# Altium project Custom_Keyboard.PrjPcb (part 2 of 4)

## Sheet Power_Section.SchDoc
size A4; SheetNumber: 2
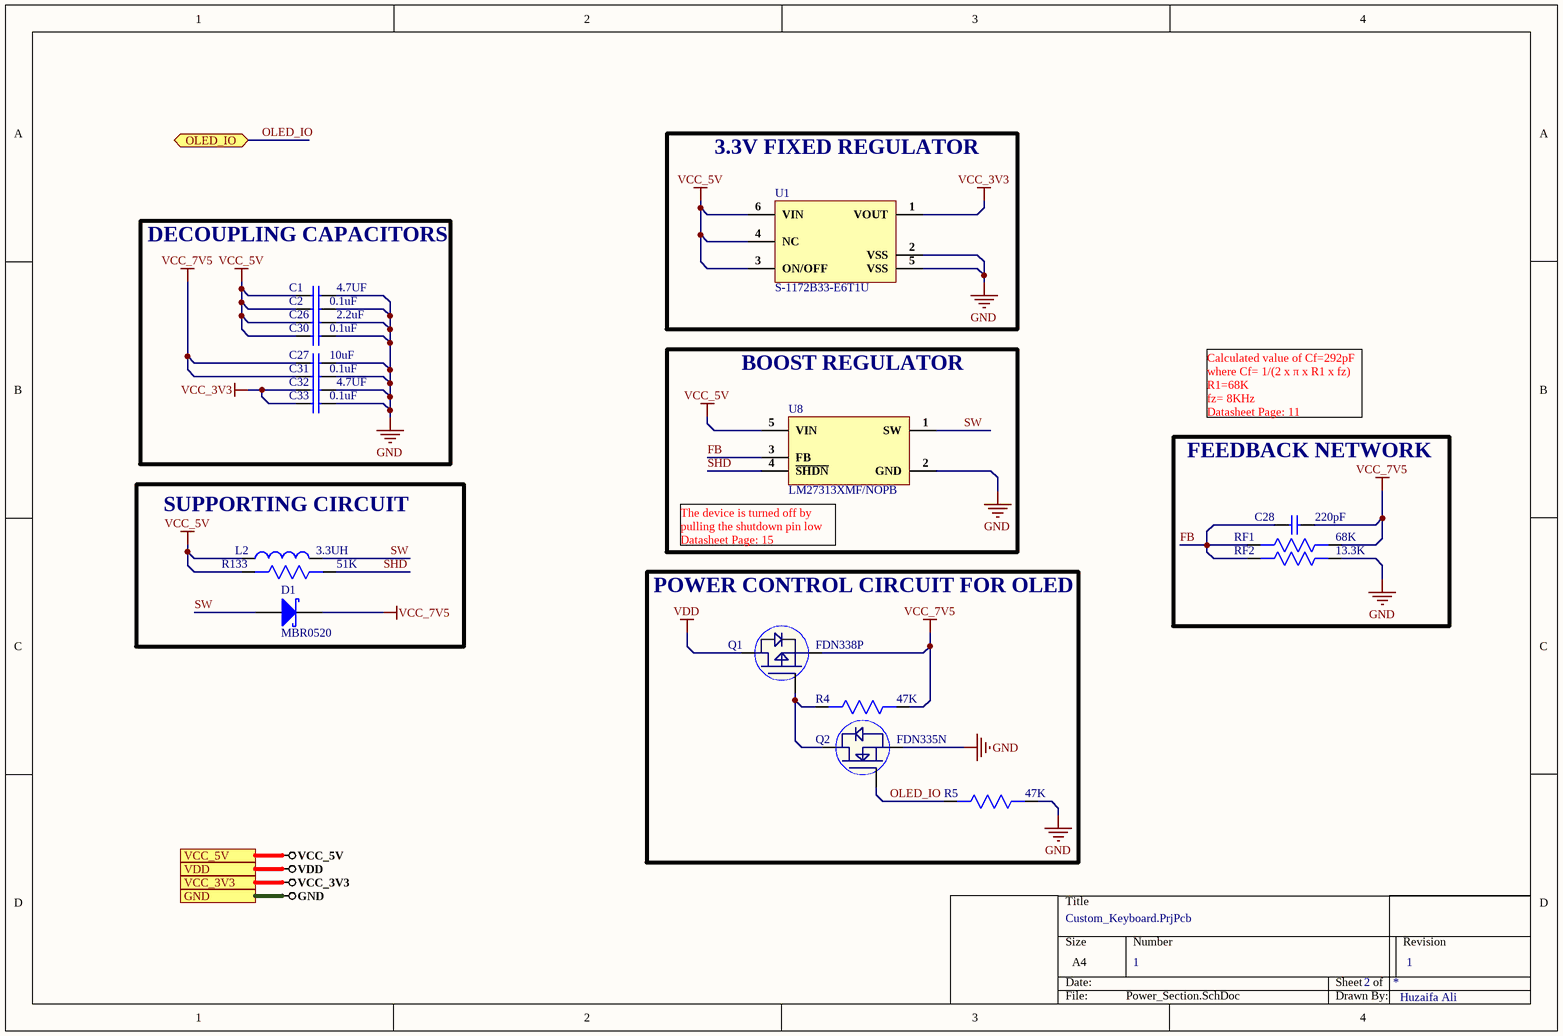
[diagram p4: Power_Section.SchDoc]

### Parts
C1  4.7UF  [Cap0603]
C2  0.1uF  [Cap0603]
C26  2.2uF  [Cap 0402]
C27  10uF  [Cap0603]
C28  220pF  [Cap0603]
C30  0.1uF  [Cap0603]
C31  0.1uF  [Cap0603]
C32  4.7UF  [Cap0603]
C33  0.1uF  [Cap0603]
D1  MBR0520  [SOD-123]
L2  3.3UH  [74437368033]
Q1  FDN338P  [SOT23-3]
Q2  FDN335N  [SOT23-3]
R4  47K  [Res0402]
R5  47K  [Res0402]
R133  51K  [Res0603]
RF1  68K  [Res0603]
RF2  13.3K  [Res0603]
U1  S-1172B33-E6T1U  [HSOP-6]
U8  LM27313XMF/NOPB  [SOT23-5]

### Blocks framed on the sheet
3.3V FIXED REGULATOR: U1
DECOUPLING CAPACITORS: C1 C2 C26 C27 C30-C33
BOOST REGULATOR: U8
FEEDBACK NETWORK: C28 RF1 RF2
SUPPORTING CIRCUIT: D1 L2 R133
POWER CONTROL CIRCUIT FOR OLED: Q1 Q2 R4 R5

### Ports
GND, OLED_IO (bidir), VCC_3V3, VCC_5V, VDD

### Nets
GND: C1.2 C2.2 C26.2 C27.2 C30.2 C31.2 C32.2 C33.2 Q2.2(S) R5.1 RF2.1 U1.2(VSS) U1.5(VSS) U8.2(GND) ; port GND
VCC_3V3: C32.1 C33.1 U1.1(VOUT) ; port VCC_3V3
VCC_5V: C1.1 C2.1 C26.1 C30.1 L2.1 R133.2 U1.3(ON/OFF) U1.4(NC) U1.6(VIN) U8.5(VIN) ; port VCC_5V
VCC_7V5: C27.1 C28.2 C31.1 D1.2(K) Q1.2(S) R4.1 RF1.1
VDD: Q1.3(D) ; port VDD
FB: C28.1 RF1.2 RF2.2 U8.3(FB)
OLED_IO: Q2.1(G) R5.2 ; port OLED_IO
SHD: R133.1 U8.4(~{SHDN})
SW: D1.1(A) L2.2 U8.1(SW)
NetQ1_1: Q1.1(G) Q2.3(D) R4.2

### Notes on the sheet
- Calculated value of Cf=292pF
  where Cf= 1/(2 x π x R1 x fz)
  R1=68K
  fz= 8KHz
  Datasheet Page: 11
- (near U8) The device is turned off by pulling the shutdown pin low
  Datasheet Page: 15
- 1
- Huzaifa Ali

### Library data of the parts
C1 C32 = CL10A475KA8NQNC: CAP CER 4.7UF 25V X5R 0603; Manufacturer: Samsung; Tolerance: 10%; Supplier 1: Digi-Key; Manufacturer Part Number: CL10A475KA8NQNC; Stock 1: 2252340; Pricing 1: 1=0.37, 10=0.255, 100=0.1528, 500=0.11456, 1000=0.09675 (USD); Mount: Surface Mount; Case/Package: 0603; Case Code (Metric): 1608; Case Code (Imperial): 0603; Contact Plating: Tin; Min Operating Temperature: -55°C; Max Operating Temperature: 85°C; Package Quantity: 1; Packaging: Tape and Reel; Capacitance: 4.7uF; Voltage Rating: 25V; Dielectric: X5R; Termination: Wraparound; Length: 1.6mm; Width: 0.031inch; Thickness: 0.035inch; Depth: 0.8mm; Lead Free: Lead Free; ComponentLink1URL: http://www.samsungsem.com/kr/support/product-search/mlcc/CL10A475KA8NQNC.jsp?src-supplier=Digi-Key; ComponentLink1Description: http://www.samsungsem.com/kr/support/product-search/mlcc/CL10A475KA8NQNC.jsp?src-supplier=Digi-Key; Supplier Part Number 1: 1276-1900-1-ND
C2 C30 C31 C33 = CC0603ZRY5V9BB104: CAP CER 0.1UF 50V Y5V 0603; Manufacturer: Yageo; Capacitance: 100nF; Tolerance: 80%; Supplier 1: Digi-Key; Manufacturer Part Number: CC0603ZRY5V9BB104; Stock 1: 15000880; Pricing 1: 1=0.1, 10=0.075, 100=0.0334, 500=0.02386, 1000=0.01874 (USD); Mount: Surface Mount; Case/Package: 0603; Number of Pins: 2; Case Code (Metric): 1608; Case Code (Imperial): 0603; Min Operating Temperature: -30°C; Max Operating Temperature: 85°C; Dielectric: Y5V; Voltage Rating: 50V; Package Quantity: 1; Packaging: Tape and Reel; Voltage Rating (DC): 50V; Termination: SMD/SMT; Composition: Ceramic; Voltage: 50V; Length: 1.6mm; Height: 0.8mm; Width: 0.031inch; Thickness: 0.035inch; Depth: 0.8mm; Radiation Hardening: No; REACH SVHC: No SVHC; Lead Free: Lead Free; Halogen Free: Halogen Free; ComponentLink1URL: http://www.yageo.com/documents/recent/UPY-GPHC_Y5V_6.3V-to-50V_8.pdf?src-supplier=Digi-Key; ComponentLink1Description: http://www.yageo.com/documents/recent/UPY-GPHC_Y5V_6.3V-to-50V_8.pdf?src-supplier=Digi-Key; ComponentLink2URL: http://www.yageo.com/documents/recent/UPY-GPHC_Y5V_6.3V-to-50V_5.pdf?src-supplier=Avnet+Europe; ComponentLink2Description: http://www.yageo.com/documents/recent/UPY-GPHC_Y5V_6.3V-to-50V_5.pdf?src-supplier=Avnet+Europe; ComponentLink3URL: https://www.verical.com/server-webapp/html/getDatasheet?partID=403611&src-supplier=Verical; ComponentLink3Description: https://www.verical.com/server-webapp/html/getDatasheet?partID=403611&src-supplier=Verical; ComponentLink4URL: http://www.mouser.com/ds/2/447/Yageo_UPY-GP_NP0_16V-to-50V_9-358835.pdf?src-supplier=Mouser; ComponentLink4Description: http://www.mouser.com/ds/2/447/Yageo_UPY-GP_NP0_16V-to-50V_9-358835.pdf?src-supplier=Mouser; ComponentLink5URL: http://www.farnell.com/datasheets/1132289.pdf?src-supplier=Element14; ComponentLink5Description: http://www.farnell.com/datasheets/1132289.pdf?src-supplier=Element14; Supplier Part Number 1: 311-1343-1-ND
C26 = EMK105ABJ225KV-F: CAP CER 2.2UF 16V X5R 0402; Manufacturer: Taiyo Yuden; Tolerance: 10%; Supplier 1: Digi-Key; Manufacturer Part Number: EMK105ABJ225KV-F; Stock 1: 755; Pricing 1: 1=0.2, 10=0.139, 100=0.0706, 500=0.04834, 1000=0.04276, 2500=0.0409, 5000=0.03718 (USD); Mount: Surface Mount; Case/Package: 0402; Case Code (Imperial): 0402; Case Code (Metric): 1005; Min Operating Temperature: -55°C; Max Operating Temperature: 85°C; Packaging: Tape and Reel; Capacitance: 2.2uF; Voltage Rating: 16V; Lead Free: Lead Free; ComponentLink1URL: http://ds.yuden.co.jp/TYCOMPAS/ut/detail.do?productNo=EMK105ABJ225KV-F&amp;fileName=EMK105ABJ225KV-F_SS&amp;mode=specSheetDownload&src-supplier=Digi-Key; ComponentLink1Description: http://ds.yuden.co.jp/TYCOMPAS/ut/detail.do?productNo=EMK105ABJ225KV-F&amp;fileName=EMK105ABJ225KV-F_SS&amp;mode=specSheetDownload&src-supplier=Digi-Key; ComponentLink2URL: https://ds.yuden.co.jp/TYCOMPAS/ut/detail?pn=EMK105ABJ225KV-F &amp;u=M&src-supplier=Digi-Key; ComponentLink2Description: https://ds.yuden.co.jp/TYCOMPAS/ut/detail?pn=EMK105ABJ225KV-F &amp;u=M&src-supplier=Digi-Key; Supplier Part Number 1: 587-6002-1-ND
C27 = C1608X5R1E106M080AC: CAP CER 10UF 25V X5R 0603; Manufacturer: TDK; Dielectric Material: Ceramic; Tolerance: 20%; Supplier 1: Digi-Key; Manufacturer Part Number: C1608X5R1E106M080AC; Stock 1: 61681; Pricing 1: 1=0.96, 10=0.704, 100=0.483, 500=0.38238, 1000=0.322 (USD); Mount: Surface Mount; Case/Package: 0603; Weight: 7.1E-05oz; Case Code (Imperial): 0603; Case Code (Metric): 1608; Min Operating Temperature: -55°C; Max Operating Temperature: 85°C; Capacitance: 10uF; Packaging: Tape and Reel; Voltage Rating: 25V; Voltage Rating (DC): 25V; Termination: SMD/SMT; Package Quantity: 1; Dielectric: X5R; Composition: Ceramic; Length: 1.6mm; Height: 0.8mm; Width: 0.8mm; Thickness: 0.039inch; Depth: 0.8mm; Lead Free: Lead Free; REACH SVHC: No SVHC; Supplier Part Number 1: 445-9015-1-ND
C28 = CC0603KRX7R9BB221: CAP CER 220PF 50V X7R 0603; Manufacturer: Yageo; Dielectric Material: Ceramic; Tolerance: 10%; Insulation Resistance: 100GR; Supplier 1: RSComponents; Manufacturer Part Number: CC0603KRX7R9BB221; RoHS: Yes; Category: Ceramic Capacitors; Stock 1: 3500; Pricing 1: 4000=0.00700, 12000=0.00700 (GBP); Mount: Surface Mount; Case/Package: 0603; Number of Pins: 2; Case Code (Metric): 1608; Case Code (Imperial): 0603; Min Operating Temperature: -55°C; Max Operating Temperature: 125°C; Capacitance: 220pF; Dielectric: X7R; Series: CC; Voltage Rating: 50V; Voltage Rating (DC): 50V; Packaging: Tape and Reel; Package Quantity: 1; Termination: SMD/SMT; Resistor Type: Ceramic; Length: 1.6mm; Width: 0.031inch; Height: 0.8mm; Depth: 0.8mm; Thickness: 0.035inch; Radiation Hardening: No; RoHS Compliant: Yes; REACH SVHC: No SVHC; Lead Free: Lead Free; Halogen Free: Halogen Free; ComponentLink1URL: https://datasheet.ciiva.com/7978/1489800-7978170.pdf?src-supplier=Element14; ComponentLink1Description: https://datasheet.ciiva.com/7978/1489800-7978170.pdf?src-supplier=Element14; ComponentLink2URL: https://datasheet.ciiva.com/144/mlccorderingcode-144452.pdf?src-supplier=Digi-Key; ComponentLink2Description: https://datasheet.ciiva.com/144/mlccorderingcode-144452.pdf?src-supplier=Digi-Key; ComponentLink3URL: https://datasheet.ciiva.com/144/mlccorderingcode-144451.pdf?src-supplier=Digi-Key; ComponentLink3Description: https://datasheet.ciiva.com/144/mlccorderingcode-144451.pdf?src-supplier=Digi-Key; ComponentLink4URL: https://datasheet.ciiva.com/144/mlccorderingcode-144453.pdf?src-supplier=Digi-Key; ComponentLink4Description: https://datasheet.ciiva.com/144/mlccorderingcode-144453.pdf?src-supplier=Digi-Key; ComponentLink5URL: https://datasheet.ciiva.com/5425/upy-gphc-x7r-6-3v-to-50v-8-5425432.pdf?src-supplier=Mouser; ComponentLink5Description: https://datasheet.ciiva.com/5425/upy-gphc-x7r-6-3v-to-50v-8-5425432.pdf?src-supplier=Mouser; ComponentLink6URL: https://datasheet.ciiva.com/8033/1489800-8033855.pdf?src-supplier=Element14; ComponentLink6Description: https://datasheet.ciiva.com/8033/1489800-8033855.pdf?src-supplier=Element14; ComponentLink7URL: https://datasheet.ciiva.com/11587/upy-gphc-x7r-6-3v-to-50v-8-11587223.pdf?src-supplier=Avnet; ComponentLink7Description: https://datasheet.ciiva.com/11587/upy-gphc-x7r-6-3v-to-50v-8-11587223.pdf?src-supplier=Avnet; Supplier Part Number 1: 2006602
D1 = MBR0520: 20V 450mV@500mA 500mA SOD-123 Schottky Barrier Diodes (SBD) ROHS; Manufacturer: Yangzhou; Manufacturer Part Number: MBR0520; ComponentLink1Description: LCSC; ComponentLink1URL: https://www.lcsc.com/product-detail/Schottky-Barrier-Diodes-SBD_Yangzhou-Yangjie-Elec-Tech-MBR0520_C699111.html
L2 = 74437368033: FIXED IND 3.3UH 8A 11.8 MOHM SMD; Manufacturer: Wurth Electronics; Core Material: Ferrite,Composite; Tolerance: 20%; Saturation Current: 23A; Shielding: Shielded; Self Resonant Frequency: 22MHz; DC Resistance (DCR): 11.8mR; Test Frequency: 100kHz; ComponentLink1URL: http://www.farnell.com/datasheets/1735871.pdf?src-supplier=Element14; ComponentLink1Description: http://www.farnell.com/datasheets/1735871.pdf?src-supplier=Element14; ComponentLink2URL: http://www.mouser.com/ds/2/445/74437368022-538992.pdf?src-supplier=Mouser; ComponentLink2Description: http://www.mouser.com/ds/2/445/74437368022-538992.pdf?src-supplier=Mouser; ComponentLink3URL: http://katalog.we-online.de/pbs/datasheet/74437368022.pdf?src-supplier=Digi-Key; ComponentLink3Description: http://katalog.we-online.de/pbs/datasheet/74437368022.pdf?src-supplier=Digi-Key; ComponentLink4URL: http://documents.rs-components.com/techlib://itc_doclist_GB.htm?stockno=7568629&src-supplier=RSComponents; ComponentLink4Description: http://documents.rs-components.com/techlib://itc_doclist_GB.htm?stockno=7568629&src-supplier=RSComponents; ComponentLink5URL: http://www.produktinfo.conrad.com/datenblaetter/1000000-1099999/001087607-da-01-ml-WE_LHMI_SMD_SPEICHERDROSSEL_744373_de_en.pdf?src-supplier=Conrad; ComponentLink5Description: http://www.produktinfo.conrad.com/datenblaetter/1000000-1099999/001087607-da-01-ml-WE_LHMI_SMD_SPEICHERDROSSEL_744373_de_en.pdf?src-supplier=Conrad; Supplier 1: Digi-Key; Manufacturer Part Number: 74437368033; RoHS: Yes; Category: Fixed Inductors; Stock 1: 1240; Pricing 1: 1=2.41000, 10=2.35900, 50=2.17700, 100=1.99600, 250=1.90500 (USD); Mount: Surface Mount; Case/Package: Nonstandard; Min Operating Temperature: -40°C; Max Operating Temperature: 125°C; Inductance Tolerance: 20%; Package Quantity: 500; Current Rating: 8A; Packaging: Tape and Reel; Resistor Type: Wirewound; Inductance: 3.3uH; Max DC Current: 8A; Termination: SMD/SMT; RMS Current (Irms): 8A; Series: WE-LHMI; Frequency: 22MHz; Series Resistance: 11.8MR; Length: 11mm; Width: 10mm; Height: 3.8mm; Height - Seated (Max): 0.157inch; Depth: 10mm; REACH SVHC: Unknown; RoHS Compliant: Yes; ComponentLink6URL: https://datasheet.ciiva.com/7354/74437368033-7354466.pdf?src-supplier=Newark; ComponentLink6Description: https://datasheet.ciiva.com/7354/74437368033-7354466.pdf?src-supplier=Newark; ComponentLink7URL: https://datasheet.ciiva.com/7691/1735872-7691596.pdf?src-supplier=Element14; ComponentLink7Description: https://datasheet.ciiva.com/7691/1735872-7691596.pdf?src-supplier=Element14; ComponentLink8URL: https://datasheet.ciiva.com/4961/74437368033-89775-4961151.pdf?src-supplier=Mouser; ComponentLink8Description: https://datasheet.ciiva.com/4961/74437368033-89775-4961151.pdf?src-supplier=Mouser; ComponentLink9URL: https://datasheet.ciiva.com/6693/74437368033-6693468.pdf?src-supplier=Digi-Key; ComponentLink9Description: https://datasheet.ciiva.com/6693/74437368033-6693468.pdf?src-supplier=Digi-Key; ComponentLink10URL: https://datasheet.ciiva.com/6693/74437368033-6693470.pdf?src-supplier=Digi-Key; ComponentLink10Description: https://datasheet.ciiva.com/6693/74437368033-6693470.pdf?src-supplier=Digi-Key; ComponentLink11URL: https://datasheet.ciiva.com/6693/74437368033-6693471.pdf?src-supplier=Digi-Key; ComponentLink11Description: https://datasheet.ciiva.com/6693/74437368033-6693471.pdf?src-supplier=Digi-Key; ComponentLink12URL: https://datasheet.ciiva.com/48690/001087608-da-01-ml-we-lhmi-smd-speicherdrossel-744373-de-en-48690487.pdf?src-supplier=Conrad; ComponentLink12Description: https://datasheet.ciiva.com/48690/001087608-da-01-ml-we-lhmi-smd-speicherdrossel-744373-de-en-48690487.pdf?src-supplier=Conrad; Supplier Part Number 1: 732-3388-1-ND
Q1 = FDN338P: 20V 1.6A 500mW 115mΩ@4.5V,1.6A 1.5V@250μA P Channel SOT-23 MOSFETs ROHS; Manufacturer: UMW; Manufacturer Part No: FDN338P; Package: SOT-23
Q2 = FDN335N: SOT-23 MOSFETs ROHS; Manufacturer: UMW; Manufacturer Part No: FDN335N; Package: SOT-23; Value: *; ComponentLink1Description: LCSC; ComponentLink1URL: https://lcsc.com/product-detail/MOSFETs_UMW-Youtai-Semiconductor-Co-Ltd-FDN335N_C347512.html
R4 R5 = RC0402FR-0747KL: RES SMD 47K OHM 1% 1/16W 0402; Manufacturer: Yageo; Power Rating: 62.5mW; Temperature Coefficient: 100ppm/°C; Voltage Rating: 50V; Resistance: 47kR; Max Power Dissipation: 63mW; Supplier 1: Digi-Key; Manufacturer Part Number: RC0402FR-0747KL; Stock 1: 0; Pricing 1: 1=0.1, 10=0.016, 100=0.0064, 1000=0.00289, 2500=0.00251, 5000=0.00207 (USD); Case/Package: 0402; Case Code (Imperial): 0402; Case Code (Metric): 1005; Min Operating Temperature: -55°C; Max Operating Temperature: 155°C; Tolerance: 1%; Packaging: Tape and Reel; Package Quantity: 1; Termination: SMD/SMT; Composition: Thick Film; Number of Terminations: 2; Military Standard: Not; Features: Moisture Resistant; Length: 1mm; Height: 0.016inch; Depth: 0.5mm; Width: 0.5mm; REACH SVHC: Unknown; Lead Free: Lead Free; ComponentLink1URL: http://www.yageo.com/documents/recent/PYu-RC0402_51_RoHS_L_6_r.pdf?src-supplier=Future+Electronics; ComponentLink1Description: http://www.yageo.com/documents/recent/PYu-RC0402_51_RoHS_L_6_r.pdf?src-supplier=Future+Electronics; ComponentLink2URL: http://www.farnell.com/datasheets/1018594.pdf?src-supplier=Element14; ComponentLink2Description: http://www.farnell.com/datasheets/1018594.pdf?src-supplier=Element14; ComponentLink3URL: https://www.verical.com/server-webapp/html/getDatasheet?partID=323748&src-supplier=Verical; ComponentLink3Description: https://www.verical.com/server-webapp/html/getDatasheet?partID=323748&src-supplier=Verical; ComponentLink4URL: http://www.yageo.com/documents/recent/PYu-RC_Group_51_RoHS_L_10.pdf?src-supplier=Digi-Key; ComponentLink4Description: http://www.yageo.com/documents/recent/PYu-RC_Group_51_RoHS_L_10.pdf?src-supplier=Digi-Key; Supplier Part Number 1: 311-47.0KLRDKR-ND
R133 = RMCF0603FT51K0: Res Thick Film 0603 51K Ohm 1% 0.1W(1/10W) ±100ppm/C Pad SMD Automotive T/R; Manufacturer: Stackpole Electronics; Resistance: 51kR; Max Power Dissipation: 100mW; Temperature Coefficient: 100ppm/°C; Supplier 1: Digi-Key; Manufacturer Part Number: RMCF0603FT51K0; RoHS: Yes; Category: Chip SMD Resistors; Stock 1: 628549; Pricing 1: 1=0.10000, 10=0.01700, 100=0.00680, 1000=0.00305, 2500=0.00264 (USD); Mount: Surface Mount; Case/Package: 0603; Case Code (Metric): 1608; Case Code (Imperial): 0603; Contact Plating: Tin,Matte; Min Operating Temperature: -55°C; Max Operating Temperature: 155°C; Tolerance: 1%; Packaging: Tape and Reel; Resistor Type: Thick Film; Number of Terminations: 2; Features: Automotive AEC-Q200; Series: RMCF; Length: 0.061inch; Width: 0.031inch; Height: 0.022inch; Radiation Hardening: No; RoHS Compliant: Yes; ComponentLink1URL: http://components.arrow.com/part/dataview/40961090S7167716N1174?src-supplier=Arrow+Electronics; ComponentLink1Description: http://components.arrow.com/part/dataview/40961090S7167716N1174?src-supplier=Arrow+Electronics; ComponentLink2URL: https://www.seielect.com/catalog/SEI-RMCF_RMCP.pdf?src-supplier=Avnet; ComponentLink2Description: https://www.seielect.com/catalog/SEI-RMCF_RMCP.pdf?src-supplier=Avnet; ComponentLink3URL: https://www.seielect.com/catalog/SEI-Packaging.pdf?src-supplier=Digi-Key; ComponentLink3Description: https://www.seielect.com/catalog/SEI-Packaging.pdf?src-supplier=Digi-Key; Supplier Part Number 1: RMCF0603FT51K0CT-ND
RF1 = RC0603FR-0768KL: RES SMD 68K OHM 1% 1/10W 0603; Manufacturer: Yageo; Power Rating: 100mW; Resistance: 68kR; Voltage Rating: 50V; Temperature Coefficient: 100ppm/°C; Supplier 1: Digi-Key; Manufacturer Part Number: RC0603FR-0768KL; Stock 1: 3330967; Pricing 1: 1=0.1, 10=0.023, 100=0.0094, 1000=0.00421, 2500=0.00366 (USD); Case/Package: 0603; Number of Pins: 2; Case Code (Metric): 1608; Case Code (Imperial): 0603; Min Operating Temperature: -55°C; Max Operating Temperature: 155°C; Package Quantity: 1; Tolerance: 1%; Packaging: Tape and Reel; Voltage Rating (DC): 50V; Composition: Thick Film; Number of Terminations: 2; Termination: SMD/SMT; Max Power Dissipation: 100mW; Features: Moisture Resistant; Length: 0.063inch; Height: 0.022inch; Width: 0.031inch; Depth: 0.8mm; REACH SVHC: Unknown; Lead Free: Lead Free; ComponentLink1URL: http://www.yageo.com/documents/recent/PYu-RC_Group_51_RoHS_L_10.pdf?src-supplier=Digi-Key; ComponentLink1Description: http://www.yageo.com/documents/recent/PYu-RC_Group_51_RoHS_L_10.pdf?src-supplier=Digi-Key; ComponentLink2URL: http://documents.rs-components.com/techlib://itc_doclist_GB.htm?stockno=5048243&src-supplier=RSComponents; ComponentLink2Description: http://documents.rs-components.com/techlib://itc_doclist_GB.htm?stockno=5048243&src-supplier=RSComponents; ComponentLink3URL: http://www.yageo.com/documents/recent/PYu-RC_Group_51_RoHS_L_9.pdf?src-supplier=Digi-Key; ComponentLink3Description: http://www.yageo.com/documents/recent/PYu-RC_Group_51_RoHS_L_9.pdf?src-supplier=Digi-Key; ComponentLink4URL: http://www.farnell.com/datasheets/1868787.pdf?src-supplier=Element14; ComponentLink4Description: http://www.farnell.com/datasheets/1868787.pdf?src-supplier=Element14; ComponentLink5URL: http://www.farnell.com/datasheets/443971.pdf?src-supplier=Element14; ComponentLink5Description: http://www.farnell.com/datasheets/443971.pdf?src-supplier=Element14; ComponentLink6URL: http://www.farnell.com/datasheets/2167052.pdf?src-supplier=Element14; ComponentLink6Description: http://www.farnell.com/datasheets/2167052.pdf?src-supplier=Element14; Supplier Part Number 1: 311-68.0KHRCT-ND
RF2 = AC0603FR-0713K3L: RES SMD 13.3K OHM 1% 1/10W 0603; Manufacturer: Yageo; Resistance: 13.3kR; Max Power Dissipation: 100mW; Temperature Coefficient: 100ppm/°C; Supplier 1: Digi-Key; Manufacturer Part Number: AC0603FR-0713K3L; RoHS: Yes; Category: Chip SMD Resistors; Stock 1: 500; Pricing 1: 1=0.10000, 10=0.02900, 100=0.01170, 1000=0.00527, 2500=0.00458 (USD); Case/Package: 0603; Min Operating Temperature: -55°C; Max Operating Temperature: 155°C; Packaging: Tape and Reel; Resistor Type: Thick Film; Number of Terminations: 2; Tolerance: 1%; Features: Moisture Resistant,Automotive AEC-Q200; Length: 0.063inch; Width: 0.031inch; Height: 0.022inch; RoHS Compliant: Yes; ComponentLink1URL: http://www.yageo.com/NewPortal/yageodocoutput?fileName=/pdf/R-Chip/PYu-AC_51_RoHS_L_6.pdf&src-supplier=Digi-Key; ComponentLink1Description: http://www.yageo.com/NewPortal/yageodocoutput?fileName=/pdf/R-Chip/PYu-AC_51_RoHS_L_6.pdf&src-supplier=Digi-Key; Supplier Part Number 1: 13-AC0603FR-0713K3LCT-ND
U1 = S-1172B33-E6T1U: IC REG LINEAR 3.3V 1A 6HSOP; Manufacturer: ABLIC; Supplier 1: Digi-Key; Manufacturer Part Number: S-1172B33-E6T1U; RoHS: Yes; Category: Voltage Regulators - Linear; Stock 1: 7813; Pricing 1: 1=1.61000, 10=1.43800, 25=1.36520, 100=1.12150, 250=1.04832, 500=0.92644, 1000=0.73140 (USD); RoHS Compliant: Yes; Supplier Part Number 1: 1662-1407-1-ND
U8 = LM27313XMF/NOPB: IC REG BOOST ADJ 0.8A SOT23-5; Manufacturer: TI National Semiconductor; Max Input Voltage: 14V; Min Input Voltage: 2.7V; Output Voltage: 28V; Number of Outputs: 1; Max Output Current: 800mA; Switching Frequency: 1.6MHz; Efficiency: 80%; Min Output Voltage: 4V; Synchronous Rectifier: No; Output Power: 2.5W; Quiescent Current: 2.1mA; Output Type: Adjustable; Output Configuration: Positive; Supplier 1: Mouser; Manufacturer Part Number: LM27313XMF/NOPB; RoHS: Yes; Category: Voltage Regulators - Switching; Pricing 1: 1=2.17000, 10=1.96000, 25=1.85000, 50=1.85000, 100=1.58000, 250=1.48000, 500=1.30000, 1000=1.07000, 10000=1.07000 (USD); Mount: Surface Mount; Case/Package: SOT-23-5; Number of Pins: 5; Contact Plating: Tin; Min Operating Temperature: -40°C; Max Operating Temperature: 125°C; Output Current: 800mA; Packaging: Tape and Reel; Package Quantity: 1; Max Output Voltage: 28V; Topology: Boost; Series: LM27313; Length: 2.92mm; Width: 1.6mm; Height: 1.02mm; Radiation Hardening: No; REACH SVHC: No SVHC; Lead Free: Lead Free; RoHS Compliant: Yes; ComponentLink1URL: https://datasheet.ciiva.com/22669/1775263-22669473.pdf?src-supplier=Element14; ComponentLink1Description: https://datasheet.ciiva.com/22669/1775263-22669473.pdf?src-supplier=Element14; ComponentLink2URL: https://datasheet.ciiva.com/27056/2038467-27056413.pdf?src-supplier=Jameco; ComponentLink2Description: https://datasheet.ciiva.com/27056/2038467-27056413.pdf?src-supplier=Jameco; ComponentLink3URL: https://datasheet.ciiva.com/23605/37176-23605316.pdf?src-supplier=Newark; ComponentLink3Description: https://datasheet.ciiva.com/23605/37176-23605316.pdf?src-supplier=Newark; ComponentLink4URL: https://datasheet.ciiva.com/25627/0900766b810fa43d-25627220.pdf?src-supplier=RSComponents; ComponentLink4Description: https://datasheet.ciiva.com/25627/0900766b810fa43d-25627220.pdf?src-supplier=RSComponents; ComponentLink5URL: https://datasheet.ciiva.com/15113/getdatasheetpartid-203533-15113382.pdf?src-supplier=Verical; ComponentLink5Description: https://datasheet.ciiva.com/15113/getdatasheetpartid-203533-15113382.pdf?src-supplier=Verical; ComponentLink6URL: https://datasheet.ciiva.com/3220/lm27313-q1-3220064.pdf?src-supplier=Avnet; ComponentLink6Description: https://datasheet.ciiva.com/3220/lm27313-q1-3220064.pdf?src-supplier=Avnet; ComponentLink7URL: https://datasheet.ciiva.com/6603/lm27313-6603792.pdf?src-supplier=Digi-Key; ComponentLink7Description: https://datasheet.ciiva.com/6603/lm27313-6603792.pdf?src-supplier=Digi-Key; ComponentLink8URL: https://datasheet.ciiva.com/6603/lm27313-6603791.pdf?src-supplier=Digi-Key; ComponentLink8Description: https://datasheet.ciiva.com/6603/lm27313-6603791.pdf?src-supplier=Digi-Key; ComponentLink9URL: https://datasheet.ciiva.com/6603/lm27313-6603788.pdf?src-supplier=Digi-Key; ComponentLink9Description: https://datasheet.ciiva.com/6603/lm27313-6603788.pdf?src-supplier=Digi-Key; Supplier Part Number 1: 926-LM27313XMF/NOPB

## Sheet Connector_Section.SchDoc
size A4
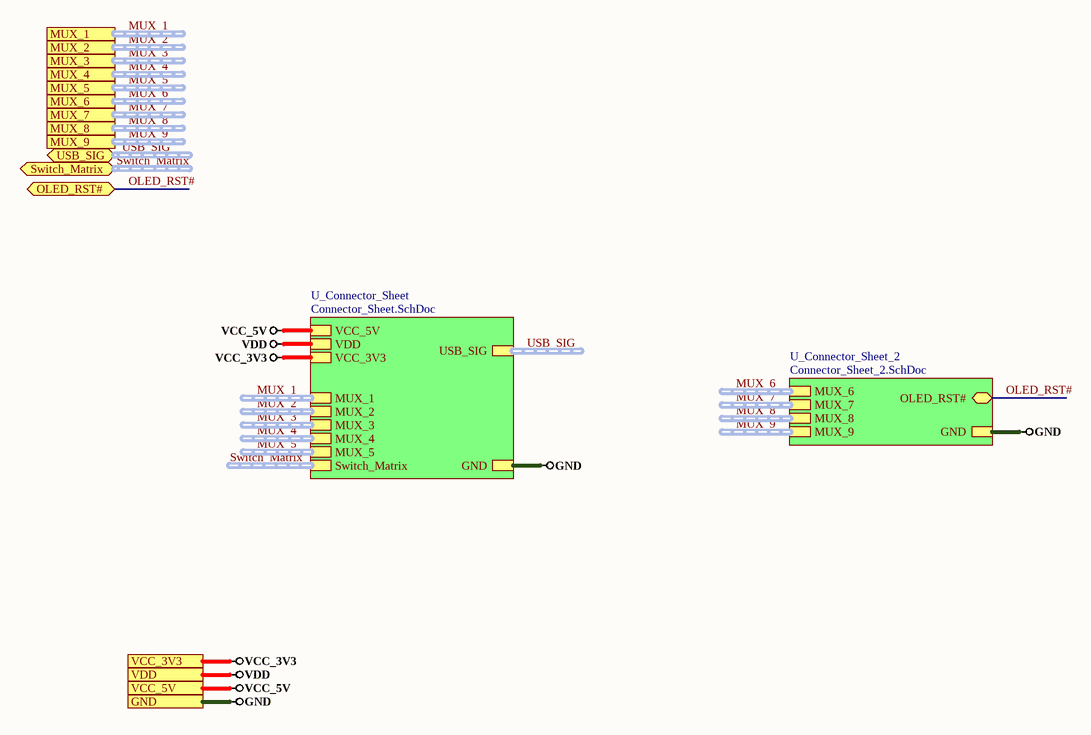
[diagram p5: Connector_Section.SchDoc]

### Sub-sheets
U_Connector_Sheet = Connector_Sheet.SchDoc: USB_SIG (harness USB_SIG), GND, VCC_5V, MUX_1 (harness MUX_1), MUX_2 (harness MUX_2), MUX_3 (harness MUX_3), MUX_4 (harness MUX_4), MUX_5 (harness MUX_5), VDD, VCC_3V3, Switch_Matrix (harness Switch_Matrix)
U_Connector_Sheet_2 = Connector_Sheet_2.SchDoc: GND, MUX_8 (harness MUX_8), MUX_9 (harness MUX_9), MUX_7 (harness MUX_7), MUX_6 (harness MUX_6), OLED_RST# (bidir)

### Ports
GND, MUX_1 (harness MUX_1), MUX_2 (harness MUX_2), MUX_3 (harness MUX_3), MUX_4 (harness MUX_4), MUX_5 (harness MUX_5), MUX_6 (harness MUX_6), MUX_7 (harness MUX_7), MUX_8 (harness MUX_8), MUX_9 (harness MUX_9), OLED_RST# (bidir), Switch_Matrix (bidir, harness Switch_Matrix), USB_SIG (bidir, harness USB_SIG), VCC_3V3, VCC_5V, VDD

### Nets
GND: port GND, sheet U_Connector_Sheet/GND, sheet U_Connector_Sheet_2/GND
VCC_3V3: port VCC_3V3, sheet U_Connector_Sheet/VCC_3V3
VCC_5V: port VCC_5V, sheet U_Connector_Sheet/VCC_5V
VDD: port VDD, sheet U_Connector_Sheet/VDD
OLED_RST#: port OLED_RST#, sheet U_Connector_Sheet_2/OLED_RST#

### Buses and harness runs
harness MUX_1 = port MUX_1
harness MUX_1 = sheet U_Connector_Sheet/MUX_1
harness MUX_2 = port MUX_2
harness MUX_2 = sheet U_Connector_Sheet/MUX_2
harness MUX_3 = port MUX_3
harness MUX_3 = sheet U_Connector_Sheet/MUX_3
harness MUX_4 = port MUX_4
harness MUX_4 = sheet U_Connector_Sheet/MUX_4
harness MUX_5 = port MUX_5
harness MUX_5 = sheet U_Connector_Sheet/MUX_5
harness MUX_6 = port MUX_6
harness MUX_6 = sheet U_Connector_Sheet_2/MUX_6
harness MUX_7 = port MUX_7
harness MUX_7 = sheet U_Connector_Sheet_2/MUX_7
harness MUX_8 = port MUX_8
harness MUX_8 = sheet U_Connector_Sheet_2/MUX_8
harness MUX_9 = port MUX_9
harness MUX_9 = sheet U_Connector_Sheet_2/MUX_9
harness Switch_Matrix = port Switch_Matrix
harness Switch_Matrix = sheet U_Connector_Sheet/Switch_Matrix
harness USB_SIG = port USB_SIG
harness USB_SIG = sheet U_Connector_Sheet/USB_SIG

### Notes on the sheet
- 1
- Huzaifa Ali

## Sheet Connector_Sheet.SchDoc
size A4; SheetNumber: 6
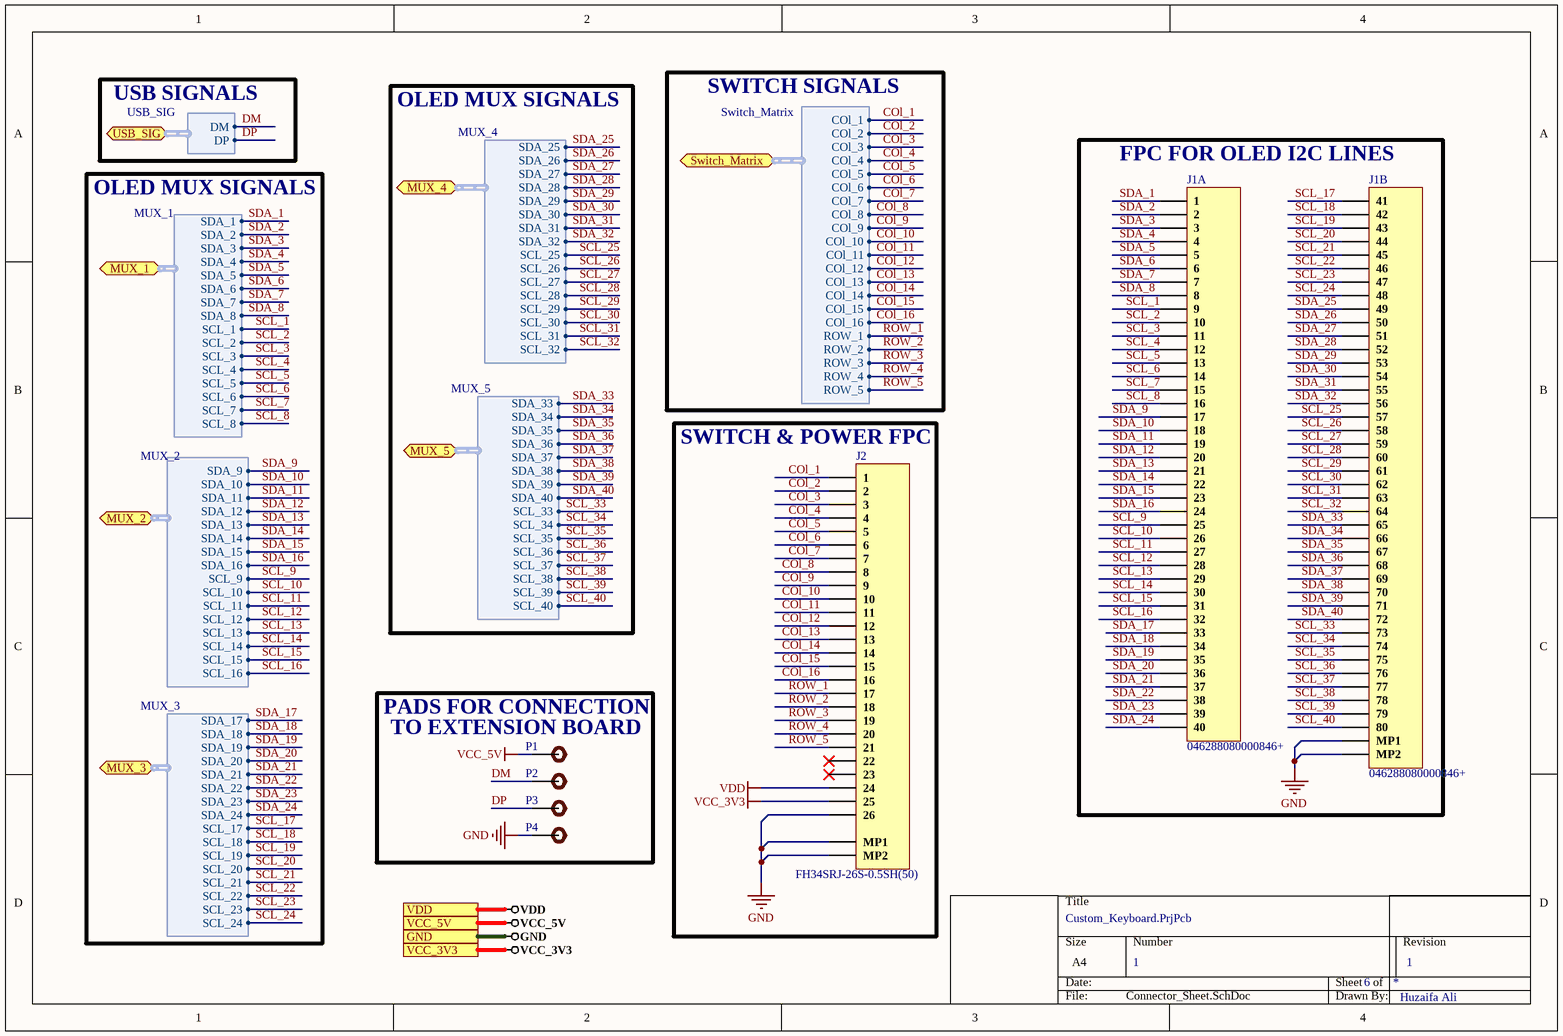
[diagram p6: Connector_Sheet.SchDoc]

### Parts
J1  046288080000846+  [046288080000846+]  (parts A,B of 2)
J2  FH34SRJ-26S-0.5SH(50)  [FH34SRJ-26S-0.5SH(50)]
P1  (no value)  [TEST POINT]
P2  (no value)  [TEST POINT]
P3  (no value)  [TEST POINT]
P4  (no value)  [TEST POINT]

### Blocks framed on the sheet
FPC FOR OLED I2C LINES: J1
SWITCH & POWER FPC: J2

### Ports
GND, MUX_1 (bidir, harness MUX_1), MUX_2 (bidir, harness MUX_2), MUX_3 (bidir, harness MUX_3), MUX_4 (bidir, harness MUX_4), MUX_5 (bidir, harness MUX_5), Switch_Matrix (bidir, harness Switch_Matrix), USB_SIG (bidir, harness USB_SIG), VCC_3V3, VCC_5V, VDD

### Harnesses
USB_SIG: DM, DP
MUX_1: SDA_1, SDA_2, SDA_3, SDA_4, SDA_5, SDA_6, SDA_7, SDA_8, SCL_1, SCL_2, SCL_3, SCL_4, SCL_5, SCL_6, SCL_7, SCL_8
MUX_2: SDA_9, SDA_10, SDA_11, SDA_12, SDA_13, SDA_14, SDA_15, SDA_16, SCL_9, SCL_10, SCL_11, SCL_12, SCL_13, SCL_14, SCL_15, SCL_16
MUX_3: SDA_17, SDA_18, SDA_19, SDA_20, SDA_21, SDA_22, SDA_23, SDA_24, SCL_17, SCL_18, SCL_19, SCL_20, SCL_21, SCL_22, SCL_23, SCL_24
MUX_4: SDA_25, SDA_26, SDA_27, SDA_28, SDA_29, SDA_30, SDA_31, SDA_32, SCL_25, SCL_26, SCL_27, SCL_28, SCL_29, SCL_30, SCL_31, SCL_32
MUX_5: SDA_33, SDA_34, SDA_35, SDA_36, SDA_37, SDA_38, SDA_39, SDA_40, SCL_33, SCL_34, SCL_35, SCL_36, SCL_37, SCL_38, SCL_39, SCL_40
Switch_Matrix: COl_1, COl_2, COl_3, COl_4, COl_5, COl_6, COl_7, ROW_1, ROW_2, ROW_3, ROW_4, ROW_5, COl_8, COl_9, COl_10, COl_11, COl_12, COl_13, COl_14, COl_15, COl_16

### Nets
GND: J1.MP1 J1.MP2 J2.26 J2.MP1 J2.MP2 P4.1 ; port GND
VCC_3V3: J2.25 ; port VCC_3V3
VCC_5V: P1.1 ; port VCC_5V
VDD: J2.24 ; port VDD
COl_1: J2.1 ; port Switch_Matrix.COl_1
COl_2: J2.2 ; port Switch_Matrix.COl_2
COl_3: J2.3 ; port Switch_Matrix.COl_3
COl_4: J2.4 ; port Switch_Matrix.COl_4
COl_5: J2.5 ; port Switch_Matrix.COl_5
COl_6: J2.6 ; port Switch_Matrix.COl_6
COl_7: J2.7 ; port Switch_Matrix.COl_7
COl_8: J2.8 ; port Switch_Matrix.COl_8
COl_9: J2.9 ; port Switch_Matrix.COl_9
COl_10: J2.10 ; port Switch_Matrix.COl_10
COl_11: J2.11 ; port Switch_Matrix.COl_11
COl_12: J2.12 ; port Switch_Matrix.COl_12
COl_13: J2.13 ; port Switch_Matrix.COl_13
COl_14: J2.14 ; port Switch_Matrix.COl_14
COl_15: J2.15 ; port Switch_Matrix.COl_15
COl_16: J2.16 ; port Switch_Matrix.COl_16
DM: P2.1 ; port USB_SIG.DM
DP: P3.1 ; port USB_SIG.DP
ROW_1: J2.17 ; port Switch_Matrix.ROW_1
ROW_2: J2.18 ; port Switch_Matrix.ROW_2
ROW_3: J2.19 ; port Switch_Matrix.ROW_3
ROW_4: J2.20 ; port Switch_Matrix.ROW_4
ROW_5: J2.21 ; port Switch_Matrix.ROW_5
SCL_1: J1.9 ; port MUX_1.SCL_1  [project net MUX_1.SCL_1]
SCL_2: J1.10 ; port MUX_1.SCL_2  [project net MUX_1.SCL_2]
SCL_3: J1.11 ; port MUX_1.SCL_3  [project net MUX_1.SCL_3]
SCL_4: J1.12 ; port MUX_1.SCL_4  [project net MUX_1.SCL_4]
SCL_5: J1.13 ; port MUX_1.SCL_5  [project net MUX_1.SCL_5]
SCL_6: J1.14 ; port MUX_1.SCL_6  [project net MUX_1.SCL_6]
SCL_7: J1.15 ; port MUX_1.SCL_7  [project net MUX_1.SCL_7]
SCL_8: J1.16 ; port MUX_1.SCL_8  [project net MUX_1.SCL_8]
SCL_9: J1.25 ; port MUX_2.SCL_9  [project net MUX_2.SCL_9]
SCL_10: J1.26 ; port MUX_2.SCL_10  [project net MUX_2.SCL_10]
SCL_11: J1.27 ; port MUX_2.SCL_11  [project net MUX_2.SCL_11]
SCL_12: J1.28 ; port MUX_2.SCL_12  [project net MUX_2.SCL_12]
SCL_13: J1.29 ; port MUX_2.SCL_13  [project net MUX_2.SCL_13]
SCL_14: J1.30 ; port MUX_2.SCL_14  [project net MUX_2.SCL_14]
SCL_15: J1.31 ; port MUX_2.SCL_15  [project net MUX_2.SCL_15]
SCL_16: J1.32 ; port MUX_2.SCL_16  [project net MUX_2.SCL_16]
SCL_17: J1.41 ; port MUX_3.SCL_17  [project net MUX_3.SCL_17]
SCL_18: J1.42 ; port MUX_3.SCL_18  [project net MUX_3.SCL_18]
SCL_19: J1.43 ; port MUX_3.SCL_19  [project net MUX_3.SCL_19]
SCL_20: J1.44 ; port MUX_3.SCL_20  [project net MUX_3.SCL_20]
SCL_21: J1.45 ; port MUX_3.SCL_21  [project net MUX_3.SCL_21]
SCL_22: J1.46 ; port MUX_3.SCL_22  [project net MUX_3.SCL_22]
SCL_23: J1.47 ; port MUX_3.SCL_23  [project net MUX_3.SCL_23]
SCL_24: J1.48 ; port MUX_3.SCL_24  [project net MUX_3.SCL_24]
SCL_25: J1.57 ; port MUX_4.SCL_25  [project net MUX_4.SCL_25]
SCL_26: J1.58 ; port MUX_4.SCL_26  [project net MUX_4.SCL_26]
SCL_27: J1.59 ; port MUX_4.SCL_27  [project net MUX_4.SCL_27]
SCL_28: J1.60 ; port MUX_4.SCL_28  [project net MUX_4.SCL_28]
SCL_29: J1.61 ; port MUX_4.SCL_29  [project net MUX_4.SCL_29]
SCL_30: J1.62 ; port MUX_4.SCL_30  [project net MUX_4.SCL_30]
SCL_31: J1.63 ; port MUX_4.SCL_31  [project net MUX_4.SCL_31]
SCL_32: J1.64 ; port MUX_4.SCL_32  [project net MUX_4.SCL_32]
SCL_33: J1.73 ; port MUX_5.SCL_33  [project net MUX_5.SCL_33]
SCL_34: J1.74 ; port MUX_5.SCL_34  [project net MUX_5.SCL_34]
SCL_35: J1.75 ; port MUX_5.SCL_35  [project net MUX_5.SCL_35]
SCL_36: J1.76 ; port MUX_5.SCL_36  [project net MUX_5.SCL_36]
SCL_37: J1.77 ; port MUX_5.SCL_37  [project net MUX_5.SCL_37]
SCL_38: J1.78 ; port MUX_5.SCL_38  [project net MUX_5.SCL_38]
SCL_39: J1.79 ; port MUX_5.SCL_39  [project net MUX_5.SCL_39]
SCL_40: J1.80 ; port MUX_5.SCL_40  [project net MUX_5.SCL_40]
SDA_1: J1.1 ; port MUX_1.SDA_1  [project net MUX_1.SDA_1]
SDA_2: J1.2 ; port MUX_1.SDA_2  [project net MUX_1.SDA_2]
SDA_3: J1.3 ; port MUX_1.SDA_3  [project net MUX_1.SDA_3]
SDA_4: J1.4 ; port MUX_1.SDA_4  [project net MUX_1.SDA_4]
SDA_5: J1.5 ; port MUX_1.SDA_5  [project net MUX_1.SDA_5]
SDA_6: J1.6 ; port MUX_1.SDA_6  [project net MUX_1.SDA_6]
SDA_7: J1.7 ; port MUX_1.SDA_7  [project net MUX_1.SDA_7]
SDA_8: J1.8 ; port MUX_1.SDA_8  [project net MUX_1.SDA_8]
SDA_9: J1.17 ; port MUX_2.SDA_9  [project net MUX_2.SDA_9]
SDA_10: J1.18 ; port MUX_2.SDA_10  [project net MUX_2.SDA_10]
SDA_11: J1.19 ; port MUX_2.SDA_11  [project net MUX_2.SDA_11]
SDA_12: J1.20 ; port MUX_2.SDA_12  [project net MUX_2.SDA_12]
SDA_13: J1.21 ; port MUX_2.SDA_13  [project net MUX_2.SDA_13]
SDA_14: J1.22 ; port MUX_2.SDA_14  [project net MUX_2.SDA_14]
SDA_15: J1.23 ; port MUX_2.SDA_15  [project net MUX_2.SDA_15]
SDA_16: J1.24 ; port MUX_2.SDA_16  [project net MUX_2.SDA_16]
SDA_17: J1.33 ; port MUX_3.SDA_17  [project net MUX_3.SDA_17]
SDA_18: J1.34 ; port MUX_3.SDA_18  [project net MUX_3.SDA_18]
SDA_19: J1.35 ; port MUX_3.SDA_19  [project net MUX_3.SDA_19]
SDA_20: J1.36 ; port MUX_3.SDA_20  [project net MUX_3.SDA_20]
SDA_21: J1.37 ; port MUX_3.SDA_21  [project net MUX_3.SDA_21]
SDA_22: J1.38 ; port MUX_3.SDA_22  [project net MUX_3.SDA_22]
SDA_23: J1.39 ; port MUX_3.SDA_23  [project net MUX_3.SDA_23]
SDA_24: J1.40 ; port MUX_3.SDA_24  [project net MUX_3.SDA_24]
SDA_25: J1.49 ; port MUX_4.SDA_25  [project net MUX_4.SDA_25]
SDA_26: J1.50 ; port MUX_4.SDA_26  [project net MUX_4.SDA_26]
SDA_27: J1.51 ; port MUX_4.SDA_27  [project net MUX_4.SDA_27]
SDA_28: J1.52 ; port MUX_4.SDA_28  [project net MUX_4.SDA_28]
SDA_29: J1.53 ; port MUX_4.SDA_29  [project net MUX_4.SDA_29]
SDA_30: J1.54 ; port MUX_4.SDA_30  [project net MUX_4.SDA_30]
SDA_31: J1.55 ; port MUX_4.SDA_31  [project net MUX_4.SDA_31]
SDA_32: J1.56 ; port MUX_4.SDA_32  [project net MUX_4.SDA_32]
SDA_33: J1.65 ; port MUX_5.SDA_33  [project net MUX_5.SDA_33]
SDA_34: J1.66 ; port MUX_5.SDA_34  [project net MUX_5.SDA_34]
SDA_35: J1.67 ; port MUX_5.SDA_35  [project net MUX_5.SDA_35]
SDA_36: J1.68 ; port MUX_5.SDA_36  [project net MUX_5.SDA_36]
SDA_37: J1.69 ; port MUX_5.SDA_37  [project net MUX_5.SDA_37]
SDA_38: J1.70 ; port MUX_5.SDA_38  [project net MUX_5.SDA_38]
SDA_39: J1.71 ; port MUX_5.SDA_39  [project net MUX_5.SDA_39]
SDA_40: J1.72 ; port MUX_5.SDA_40  [project net MUX_5.SDA_40]

Not connected (* = marked no-connect by the designer): J2 22* 23*

### Notes on the sheet
- USB SIGNALS
- OLED MUX SIGNALS
- SWITCH SIGNALS
- (near P1) PADS FOR CONNECTION
- (near P1) TO EXTENSION BOARD
- 1
- Huzaifa Ali

### Library data of the parts
J1 = 046288080000846+: 0.5MM PITCH - 80 POS - RIGHT ANG; Manufacturer: Kyocera AVX; ComponentLink1Description: LCSC; ComponentLink1URL: https://lcsc.com/product-detail/FFC-span-style-background-color-ff0-FPC-span-Connectors_Kyocera-046288080000846_C513346.html; Manufacturer Part Number: 046288080000846+; Footprint: Custom
J2 = FH34SRJ-26S-0.5SH(50): CONN FFC FPC 26POS 0.50MM R/A; Manufacturer: Hirose; Manufacturer Part Number: FH34SRJ-8S-0.5SH(99); Supplier 1: RSComponents; RoHS: Yes; Category: FFC / FPC; Stock 1: 190; Pricing 1: 5=2.79500, 25=2.28400, 100=2.17100, 250=1.96400 (USD); ComponentLink1URL: https://datasheet.ciiva.com/18561/ed-fh34s-20140305-18561974.pdf?src-supplier=Digi-Key; ComponentLink1Description: https://datasheet.ciiva.com/18561/ed-fh34s-20140305-18561974.pdf?src-supplier=Digi-Key; Supplier Part Number 1: 1362475
P1-P4 = TEST POINT: Test Point ON

## Sheet Connector_Sheet_2.SchDoc
size A4
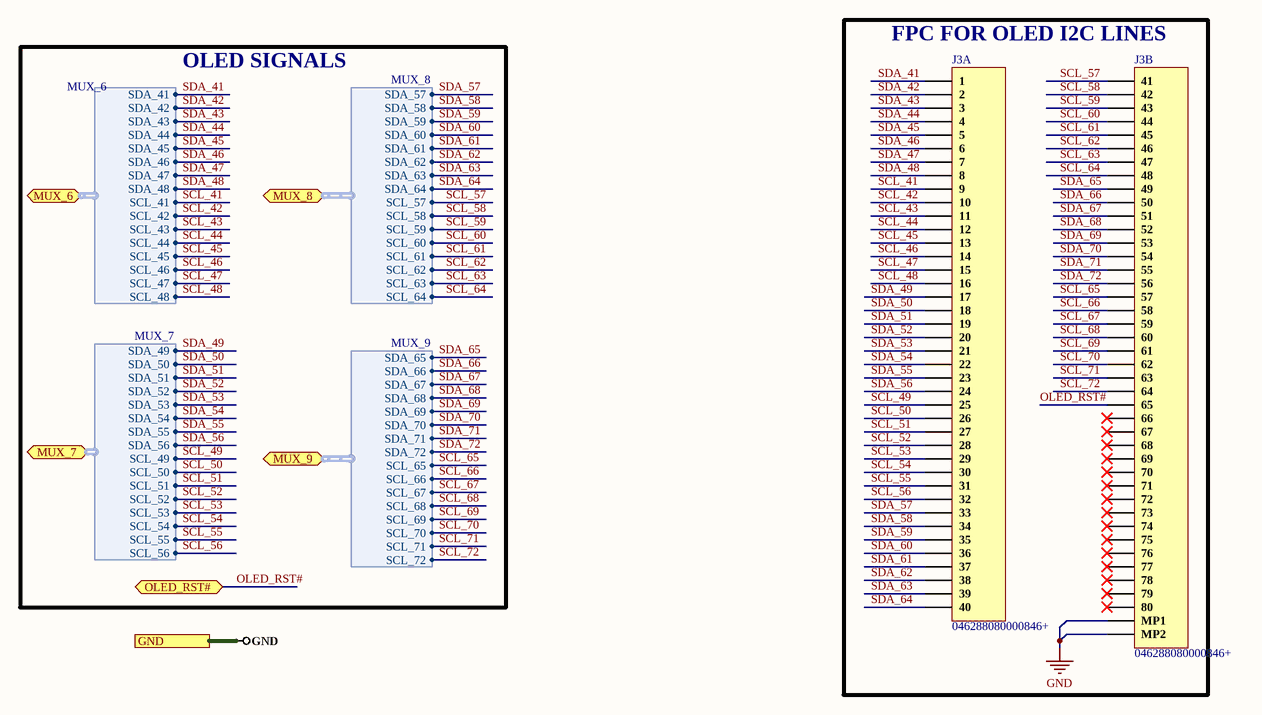
[diagram p7: Connector_Sheet_2.SchDoc]

### Parts
J3  046288080000846+  [046288080000846+]  (parts A,B of 2)

### Blocks framed on the sheet
FPC FOR OLED I2C LINES: J3

### Ports
GND, MUX_6 (bidir, harness MUX_6), MUX_7 (bidir, harness MUX_7), MUX_8 (bidir, harness MUX_8), MUX_9 (bidir, harness MUX_9), OLED_RST# (bidir)

### Harnesses
MUX_8: SDA_57, SDA_58, SDA_59, SDA_60, SDA_61, SDA_62, SDA_63, SDA_64, SCL_57, SCL_58, SCL_59, SCL_60, SCL_61, SCL_62, SCL_63, SCL_64
MUX_9: SDA_65, SDA_66, SDA_67, SDA_68, SDA_69, SDA_70, SDA_71, SDA_72, SCL_65, SCL_66, SCL_67, SCL_68, SCL_69, SCL_70, SCL_71, SCL_72
MUX_7: SDA_49, SDA_50, SDA_51, SDA_52, SDA_53, SDA_54, SDA_55, SDA_56, SCL_49, SCL_50, SCL_51, SCL_52, SCL_53, SCL_54, SCL_55, SCL_56
MUX_6: SDA_41, SDA_42, SDA_43, SDA_44, SDA_45, SDA_46, SDA_47, SDA_48, SCL_41, SCL_42, SCL_43, SCL_44, SCL_45, SCL_46, SCL_47, SCL_48

### Nets
GND: J3.MP1 J3.MP2 ; port GND
OLED_RST#: J3.65 ; port OLED_RST#
SCL_41: J3.9 ; port MUX_6.SCL_41  [project net MUX_6.SCL_41]
SCL_42: J3.10 ; port MUX_6.SCL_42  [project net MUX_6.SCL_42]
SCL_43: J3.11 ; port MUX_6.SCL_43  [project net MUX_6.SCL_43]
SCL_44: J3.12 ; port MUX_6.SCL_44  [project net MUX_6.SCL_44]
SCL_45: J3.13 ; port MUX_6.SCL_45  [project net MUX_6.SCL_45]
SCL_46: J3.14 ; port MUX_6.SCL_46  [project net MUX_6.SCL_46]
SCL_47: J3.15 ; port MUX_6.SCL_47  [project net MUX_6.SCL_47]
SCL_48: J3.16 ; port MUX_6.SCL_48  [project net MUX_6.SCL_48]
SCL_49: J3.25 ; port MUX_7.SCL_49  [project net MUX_7.SCL_49]
SCL_50: J3.26 ; port MUX_7.SCL_50  [project net MUX_7.SCL_50]
SCL_51: J3.27 ; port MUX_7.SCL_51  [project net MUX_7.SCL_51]
SCL_52: J3.28 ; port MUX_7.SCL_52  [project net MUX_7.SCL_52]
SCL_53: J3.29 ; port MUX_7.SCL_53  [project net MUX_7.SCL_53]
SCL_54: J3.30 ; port MUX_7.SCL_54  [project net MUX_7.SCL_54]
SCL_55: J3.31 ; port MUX_7.SCL_55  [project net MUX_7.SCL_55]
SCL_56: J3.32 ; port MUX_7.SCL_56  [project net MUX_7.SCL_56]
SCL_57: J3.41 ; port MUX_8.SCL_57  [project net MUX_8.SCL_57]
SCL_58: J3.42 ; port MUX_8.SCL_58  [project net MUX_8.SCL_58]
SCL_59: J3.43 ; port MUX_8.SCL_59  [project net MUX_8.SCL_59]
SCL_60: J3.44 ; port MUX_8.SCL_60  [project net MUX_8.SCL_60]
SCL_61: J3.45 ; port MUX_8.SCL_61  [project net MUX_8.SCL_61]
SCL_62: J3.46 ; port MUX_8.SCL_62  [project net MUX_8.SCL_62]
SCL_63: J3.47 ; port MUX_8.SCL_63  [project net MUX_8.SCL_63]
SCL_64: J3.48 ; port MUX_8.SCL_64  [project net MUX_8.SCL_64]
SCL_65: J3.57 ; port MUX_9.SCL_65  [project net MUX_9.SCL_65]
SCL_66: J3.58 ; port MUX_9.SCL_66  [project net MUX_9.SCL_66]
SCL_67: J3.59 ; port MUX_9.SCL_67  [project net MUX_9.SCL_67]
SCL_68: J3.60 ; port MUX_9.SCL_68  [project net MUX_9.SCL_68]
SCL_69: J3.61 ; port MUX_9.SCL_69  [project net MUX_9.SCL_69]
SCL_70: J3.62 ; port MUX_9.SCL_70  [project net MUX_9.SCL_70]
SCL_71: J3.63 ; port MUX_9.SCL_71  [project net MUX_9.SCL_71]
SCL_72: J3.64 ; port MUX_9.SCL_72  [project net MUX_9.SCL_72]
SDA_41: J3.1 ; port MUX_6.SDA_41  [project net MUX_6.SDA_41]
SDA_42: J3.2 ; port MUX_6.SDA_42  [project net MUX_6.SDA_42]
SDA_43: J3.3 ; port MUX_6.SDA_43  [project net MUX_6.SDA_43]
SDA_44: J3.4 ; port MUX_6.SDA_44  [project net MUX_6.SDA_44]
SDA_45: J3.5 ; port MUX_6.SDA_45  [project net MUX_6.SDA_45]
SDA_46: J3.6 ; port MUX_6.SDA_46  [project net MUX_6.SDA_46]
SDA_47: J3.7 ; port MUX_6.SDA_47  [project net MUX_6.SDA_47]
SDA_48: J3.8 ; port MUX_6.SDA_48  [project net MUX_6.SDA_48]
SDA_49: J3.17 ; port MUX_7.SDA_49  [project net MUX_7.SDA_49]
SDA_50: J3.18 ; port MUX_7.SDA_50  [project net MUX_7.SDA_50]
SDA_51: J3.19 ; port MUX_7.SDA_51  [project net MUX_7.SDA_51]
SDA_52: J3.20 ; port MUX_7.SDA_52  [project net MUX_7.SDA_52]
SDA_53: J3.21 ; port MUX_7.SDA_53  [project net MUX_7.SDA_53]
SDA_54: J3.22 ; port MUX_7.SDA_54  [project net MUX_7.SDA_54]
SDA_55: J3.23 ; port MUX_7.SDA_55  [project net MUX_7.SDA_55]
SDA_56: J3.24 ; port MUX_7.SDA_56  [project net MUX_7.SDA_56]
SDA_57: J3.33 ; port MUX_8.SDA_57  [project net MUX_8.SDA_57]
SDA_58: J3.34 ; port MUX_8.SDA_58  [project net MUX_8.SDA_58]
SDA_59: J3.35 ; port MUX_8.SDA_59  [project net MUX_8.SDA_59]
SDA_60: J3.36 ; port MUX_8.SDA_60  [project net MUX_8.SDA_60]
SDA_61: J3.37 ; port MUX_8.SDA_61  [project net MUX_8.SDA_61]
SDA_62: J3.38 ; port MUX_8.SDA_62  [project net MUX_8.SDA_62]
SDA_63: J3.39 ; port MUX_8.SDA_63  [project net MUX_8.SDA_63]
SDA_64: J3.40 ; port MUX_8.SDA_64  [project net MUX_8.SDA_64]
SDA_65: J3.49 ; port MUX_9.SDA_65  [project net MUX_9.SDA_65]
SDA_66: J3.50 ; port MUX_9.SDA_66  [project net MUX_9.SDA_66]
SDA_67: J3.51 ; port MUX_9.SDA_67  [project net MUX_9.SDA_67]
SDA_68: J3.52 ; port MUX_9.SDA_68  [project net MUX_9.SDA_68]
SDA_69: J3.53 ; port MUX_9.SDA_69  [project net MUX_9.SDA_69]
SDA_70: J3.54 ; port MUX_9.SDA_70  [project net MUX_9.SDA_70]
SDA_71: J3.55 ; port MUX_9.SDA_71  [project net MUX_9.SDA_71]
SDA_72: J3.56 ; port MUX_9.SDA_72  [project net MUX_9.SDA_72]

Not connected (* = marked no-connect by the designer): J3 66* 67* 68* 69* 70* 71* 72* 73* 74* 75* 76* 77* 78* 79* 80*

### Notes on the sheet
- OLED SIGNALS
- 1
- Huzaifa Ali

### Library data of the parts
J3 = 046288080000846+: as J1 on sheet Connector_Sheet; ComponentLink1Description: LCSC; ComponentLink1URL: https://lcsc.com/product-detail/FFC-span-style-background-color-ff0-FPC-span-Connectors_Kyocera-046288080000846_C513346.html; Manufacturer Part Number: 046288080000846+; Footprint: Custom

## Sheet I2C_Mux_Section.SchDoc
size A4; SheetNumber: 5
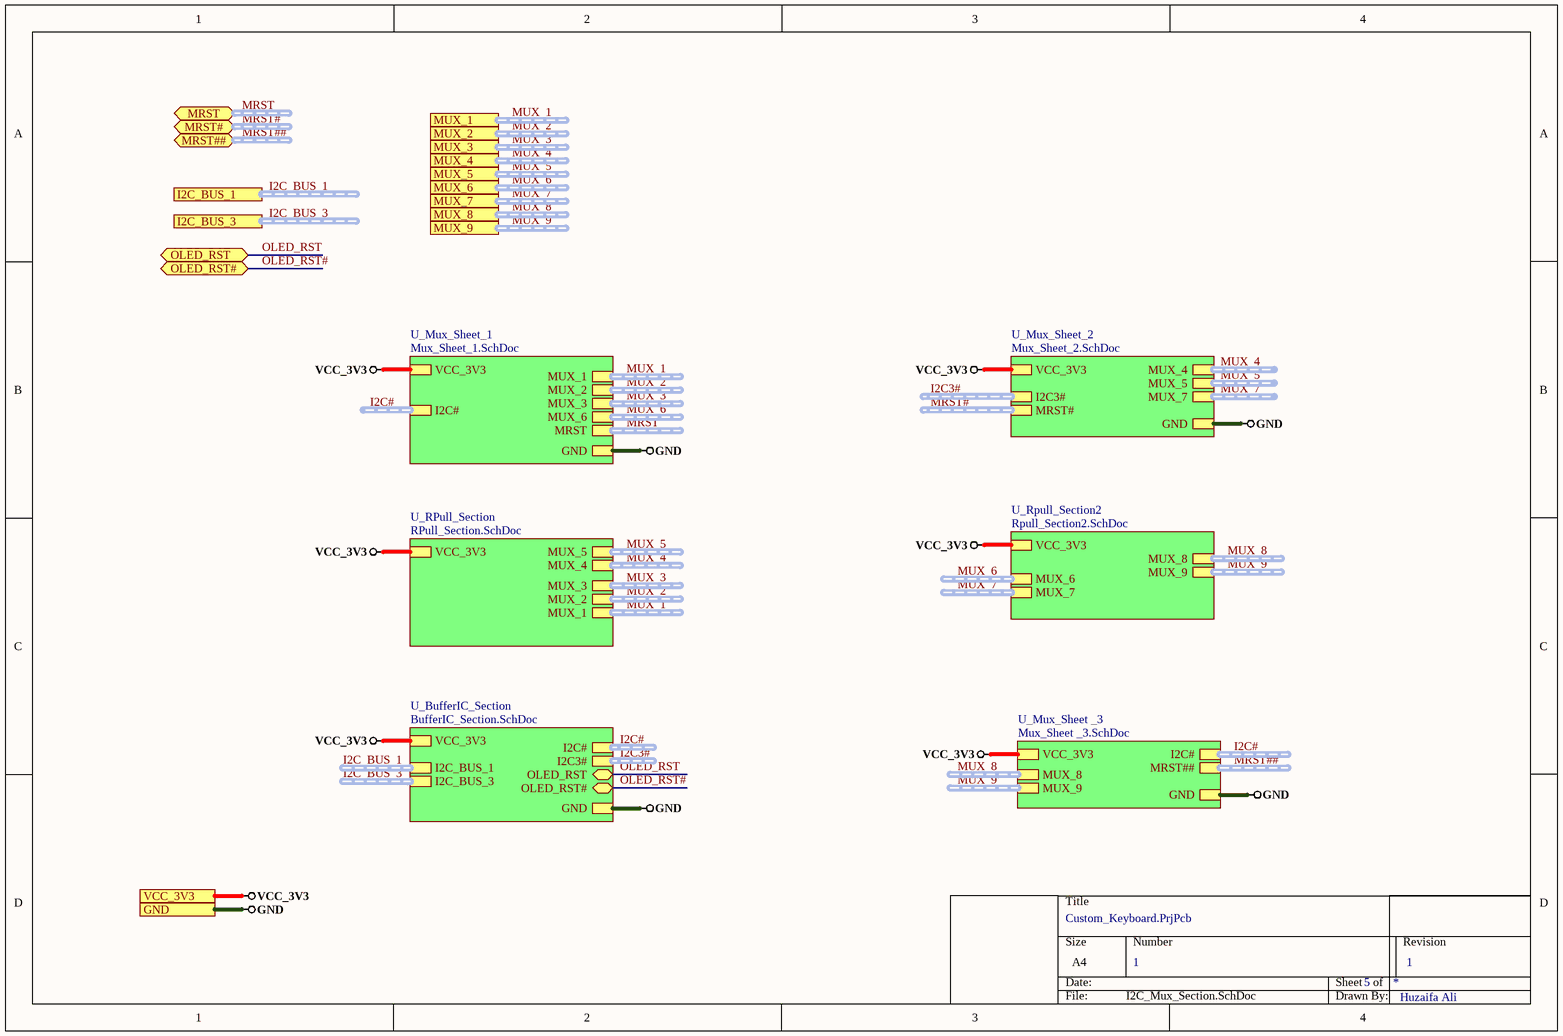
[diagram p8: I2C_Mux_Section.SchDoc]

### Sub-sheets
U_BufferIC_Section = BufferIC_Section.SchDoc: I2C_BUS_1 (harness I2C_BUS_1), I2C_BUS_3 (harness I2C_BUS_3), I2C# (harness I2C#), I2C3# (harness I2C3#), VCC_3V3, GND, OLED_RST (bidir), OLED_RST# (bidir)
U_Mux_Sheet _3 = Mux_Sheet _3.SchDoc: I2C# (harness I2C#), MUX_8 (harness MUX_8), MUX_9 (harness MUX_9), MRST## (harness MRST##), VCC_3V3, GND
U_Mux_Sheet_1 = Mux_Sheet_1.SchDoc: I2C# (harness I2C#), VCC_3V3, GND, MUX_1 (harness MUX_1), MUX_2 (harness MUX_2), MUX_3 (harness MUX_3), MUX_6 (harness MUX_6), MRST (harness MRST)
U_Mux_Sheet_2 = Mux_Sheet_2.SchDoc: VCC_3V3, GND, MUX_4 (harness MUX_4), MUX_5 (harness MUX_5), I2C3# (harness I2C3#), MUX_7 (harness MUX_7), MRST# (harness MRST#)
U_RPull_Section = RPull_Section.SchDoc: MUX_4 (harness MUX_4), MUX_5 (harness MUX_5), MUX_1 (harness MUX_1), MUX_2 (harness MUX_2), MUX_3 (harness MUX_3), VCC_3V3
U_Rpull_Section2 = Rpull_Section2.SchDoc: MUX_7 (harness MUX_7), MUX_8 (harness MUX_8), MUX_9 (harness MUX_9), MUX_6 (harness MUX_6), VCC_3V3

### Ports
GND, I2C_BUS_1 (harness I2C_BUS_1), I2C_BUS_3 (harness I2C_BUS_3), MRST (bidir, harness MRST), MRST# (bidir, harness MRST#), MRST## (bidir, harness MRST##), MUX_1 (harness MUX_1), MUX_2 (harness MUX_2), MUX_3 (harness MUX_3), MUX_4 (harness MUX_4), MUX_5 (harness MUX_5), MUX_6 (harness MUX_6), MUX_7 (harness MUX_7), MUX_8 (harness MUX_8), MUX_9 (harness MUX_9), OLED_RST (bidir), OLED_RST# (bidir), VCC_3V3

### Nets
GND: port GND, sheet U_Mux_Sheet_1/GND, sheet U_Mux_Sheet_2/GND, sheet U_Mux_Sheet _3/GND, sheet U_BufferIC_Section/GND
VCC_3V3: port VCC_3V3, sheet U_Mux_Sheet_1/VCC_3V3, sheet U_Mux_Sheet_2/VCC_3V3, sheet U_RPull_Section/VCC_3V3, sheet U_Rpull_Section2/VCC_3V3, sheet U_Mux_Sheet _3/VCC_3V3, sheet U_BufferIC_Section/VCC_3V3
OLED_RST: port OLED_RST, sheet U_BufferIC_Section/OLED_RST
OLED_RST#: port OLED_RST#, sheet U_BufferIC_Section/OLED_RST#

### Buses and harness runs
harness I2C3# = sheet U_BufferIC_Section/I2C3#
harness I2C3# = sheet U_Mux_Sheet_2/I2C3#
harness I2C# = sheet U_BufferIC_Section/I2C#
harness I2C# = sheet U_Mux_Sheet _3/I2C#
harness I2C# = sheet U_Mux_Sheet_1/I2C#
harness I2C_BUS_1 = port I2C_BUS_1
harness I2C_BUS_1 = sheet U_BufferIC_Section/I2C_BUS_1
harness I2C_BUS_3 = port I2C_BUS_3
harness I2C_BUS_3 = sheet U_BufferIC_Section/I2C_BUS_3
harness MRST = port MRST
harness MRST = sheet U_Mux_Sheet_1/MRST
harness MRST# = port MRST#
harness MRST# = sheet U_Mux_Sheet_2/MRST#
harness MRST## = port MRST##
harness MRST## = sheet U_Mux_Sheet _3/MRST##
harness MUX_1 = port MUX_1
harness MUX_1 = sheet U_Mux_Sheet_1/MUX_1
harness MUX_1 = sheet U_RPull_Section/MUX_1
harness MUX_2 = port MUX_2
harness MUX_2 = sheet U_Mux_Sheet_1/MUX_2
harness MUX_2 = sheet U_RPull_Section/MUX_2
harness MUX_3 = port MUX_3
harness MUX_3 = sheet U_Mux_Sheet_1/MUX_3
harness MUX_3 = sheet U_RPull_Section/MUX_3
harness MUX_4 = port MUX_4
harness MUX_4 = sheet U_Mux_Sheet_2/MUX_4
harness MUX_4 = sheet U_RPull_Section/MUX_4
harness MUX_5 = port MUX_5
harness MUX_5 = sheet U_Mux_Sheet_2/MUX_5
harness MUX_5 = sheet U_RPull_Section/MUX_5
harness MUX_6 = port MUX_6
harness MUX_6 = sheet U_Mux_Sheet_1/MUX_6
harness MUX_6 = sheet U_Rpull_Section2/MUX_6
harness MUX_7 = port MUX_7
harness MUX_7 = sheet U_Mux_Sheet_2/MUX_7
harness MUX_7 = sheet U_Rpull_Section2/MUX_7
harness MUX_8 = port MUX_8
harness MUX_8 = sheet U_Mux_Sheet _3/MUX_8
harness MUX_8 = sheet U_Rpull_Section2/MUX_8
harness MUX_9 = port MUX_9
harness MUX_9 = sheet U_Mux_Sheet _3/MUX_9
harness MUX_9 = sheet U_Rpull_Section2/MUX_9

### Notes on the sheet
- 1
- Huzaifa Ali